# EasyEDA Pro project SOP100E 2025.05.27.eprj, board PCB2
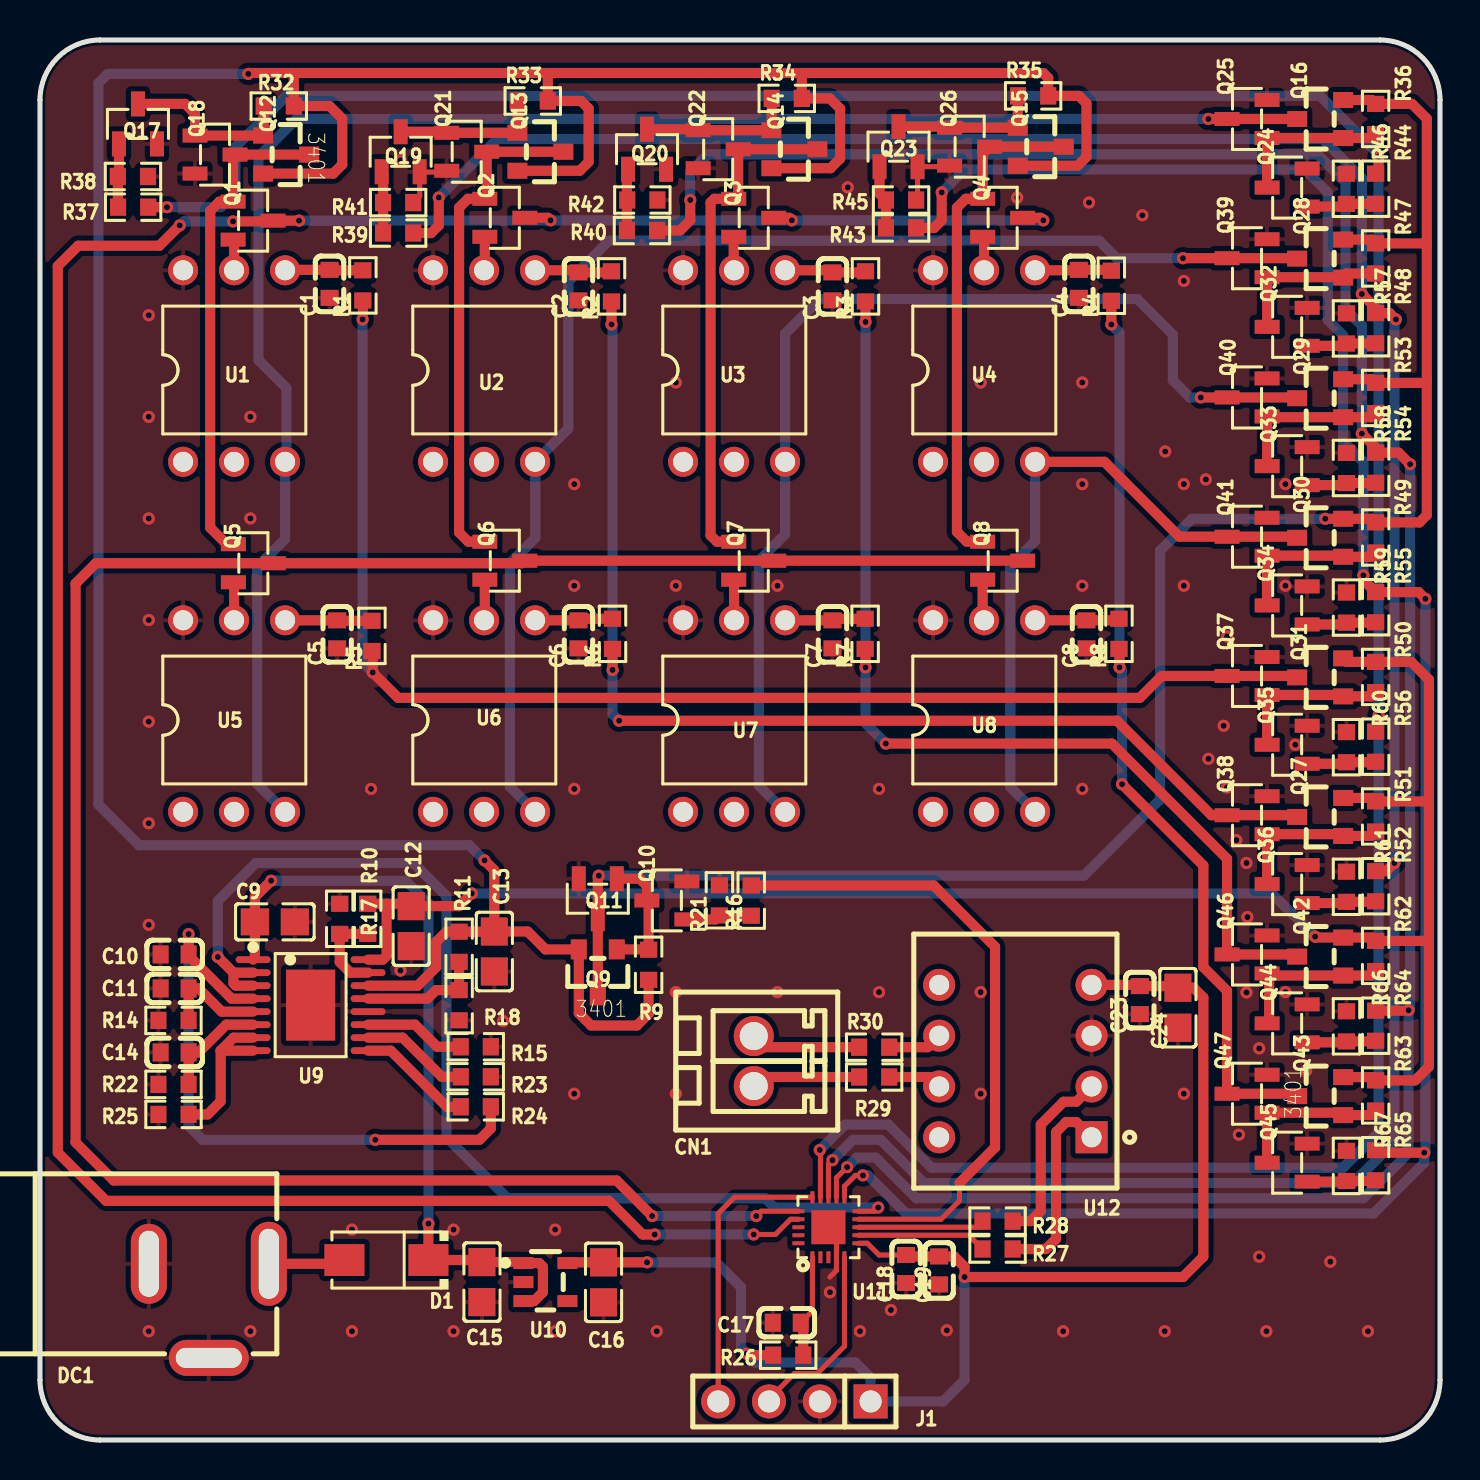
[diagram p17: board, top side]
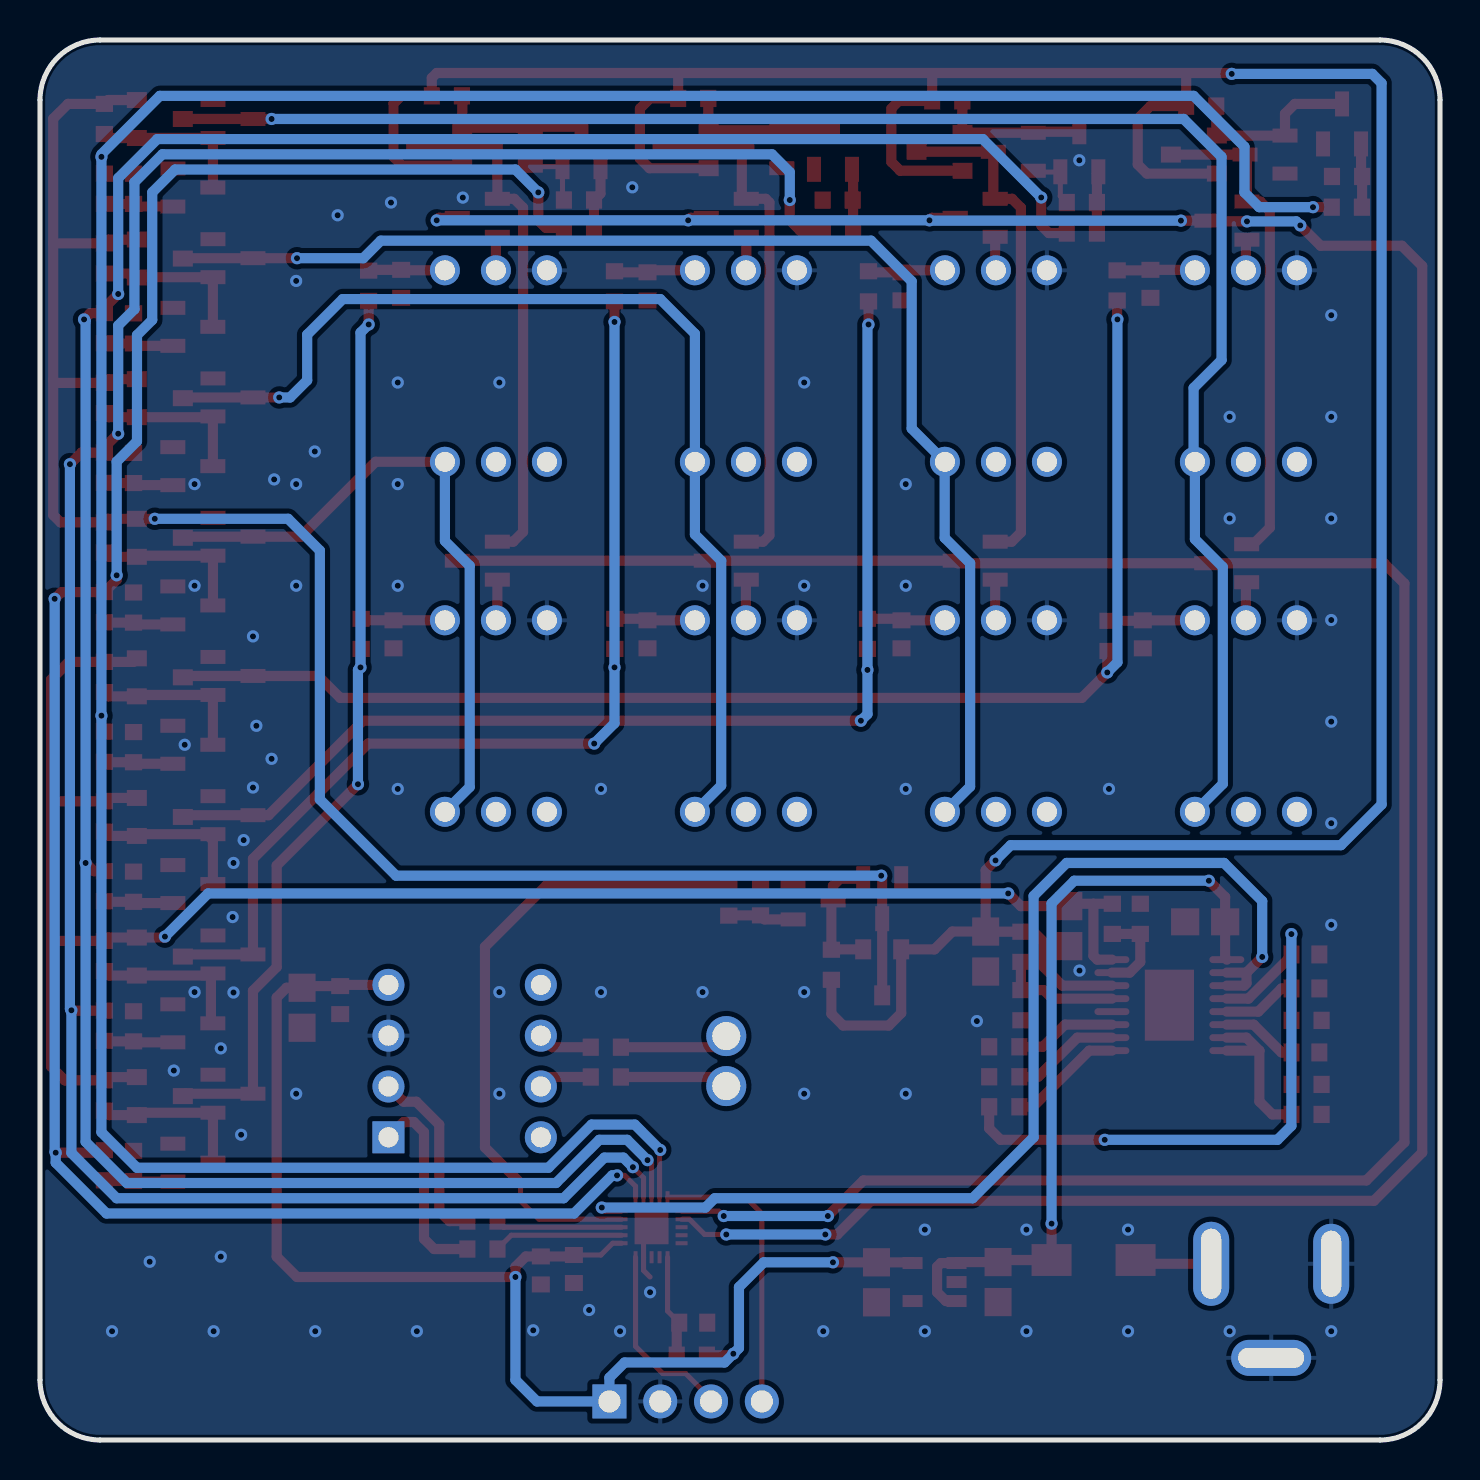
[diagram p18: board, bottom side, seen from below]

Outline 70 x 70 mm; copper layers: Top Layer, Bottom Layer. Coordinates in mm from the lower left corner of the outline.
Outline path: 0,67 0,3 arc(0.88,0.88) 3,0 67,0 arc(69.12,0.88) 70,3 70,67 arc(69.12,69.12) 67,70 3,70 arc(0.88,69.12) 0,67
Stack: Top Layer 0.035mm / Dielectric1 1.51mm FR4 er 4.5 / Bottom Layer 0.035mm

## Design rules (mm)
template: JLCPCB Capability(Two Layers Board)
spacing copperThickness1oz (default): track to track 0.102, other pairs 0.152 to 0.3
spacing copperThickness2oz: track to track 0.203, other pairs 0.152 to 0.3
track width copperThickness1oz (default): min 0.127, default 0.254, max 2.54
track width copperThickness2oz: min 0.203, default 0.254, max 2.54
differential pair differentialPair (default): width min 0.127, default 0.254, max 2.54; gap min 0.152, default 0.152
via viaSize (default): diameter min 0.5, default 0.61, max 10; hole min 0.3, default 0.305, max 6.3

## Placement (name value [footprint] x y rotation side)
C1  100nF  [C0603]  14.48 57.81 90 top
C2  100nF  [C0603]  26.92 57.68 90 top
C3  100nF  [C0603]  39.62 57.68 90 top
C4  100nF  [C0603]  51.94 57.81 90 top
C5  100nF  [C0603]  14.86 40.28 90 top
C6  100nF  [C0603]  26.92 40.28 90 top
C7  100nF  [C0603]  39.62 40.28 90 top
C8  100nF  [C0603]  52.32 40.28 90 top
C9  22uF  [C0805]  11.74 25.91 0 top
C10  1uF  [C0603]  6.73 24.28 0 top
C11  1uF  [C0603]  6.73 22.58 0 top
C12  22uF  [C0805]  18.56 25.69 90 top
C13  22uF  [C0805]  22.72 24.42 90 top
C14  1uF  [C0603]  6.73 19.38 0 top
C15  22uF  [C0805]  22.1 7.9 90 top
C16  22uF  [C0805]  28.18 7.88 90 top
C17  100nF  [C0603]  37.34 5.87 0 top
C18  100nF  [C0603]  43.31 8.55 90 top
C19  100nF  [C0603]  44.96 8.48 90 top
C23  100nF  [C0603]  54.99 21.99 270 top
C24  22uF  [C0805]  56.9 21.61 270 top
CN1  DB2EVC-2.5-2P-GN  [CONN-TH_2P-P2.50_DB2EVC-2.5-2P-GN]  35.69 18.95 90 top
D1  SS34  [SMA_L4.3-W2.5-LS5.0-RD]  17.32 9 180 top
DC1  DC-005-5A-2.0  [DC-IN-TH_DC-005-5A-2.0]  8.44 6.46 0 top
J1  PZ254V-11-04P  [HDR-TH_4P-P2.54-V-M]  37.72 1.93 180 top
Q1  AO3400A  [SOT-23-3_L2.9-W1.3-P1.90-LS2.4-BR]  10.66 60.97 180 top
Q2  AO3400A  [SOT-23-3_L2.9-W1.3-P1.90-LS2.4-BR]  23.24 61.11 180 top
Q3  AO3400A  [SOT-23-3_L2.9-W1.3-P1.90-LS2.4-BR]  35.69 61.11 180 top
Q4  AO3400A  [SOT-23-3_L2.9-W1.3-P1.90-LS2.4-BR]  48.13 61.11 180 top
Q5  AO3400A  [SOT-23-3_L2.9-W1.3-P1.90-LS2.4-BR]  10.67 43.84 180 top
Q6  AO3400A  [SOT-23-3_L2.9-W1.3-P1.90-LS2.4-BR]  23.24 43.97 180 top
Q7  AO3400A  [SOT-23-3_L2.9-W1.3-P1.90-LS2.4-BR]  35.69 43.97 180 top
Q8  AO3400A  [SOT-23-3_L2.9-W1.3-P1.90-LS2.4-BR]  48.13 43.97 180 top
Q9  AO3401A  [SOT-23_L2.9-W1.3-P1.90-LS2.4-BR]  27.89 23.38 90 top
Q10  AO3400A  [SOT-23-3_L2.9-W1.3-P1.90-LS2.4-BR]  31.34 26.98 0 top
Q11  AO3400A  [SOT-23-3_L2.9-W1.3-P1.90-LS2.4-BR]  27.89 27.06 90 top
Q12  AO3401A  [SOT-23_L2.9-W1.3-P1.90-LS2.4-BR]  12.31 64.27 180 top
Q13  AO3401A  [SOT-23_L2.9-W1.3-P1.90-LS2.4-BR]  25.02 64.41 180 top
Q14  AO3401A  [SOT-23_L2.9-W1.3-P1.90-LS2.4-BR]  37.72 64.54 180 top
Q15  AO3401A  [SOT-23_L2.9-W1.3-P1.90-LS2.4-BR]  50.04 64.67 180 top
Q16  AO3401A  [SOT-23_L2.9-W1.3-P1.90-LS2.4-BR]  64.01 66.05 0 top
Q17  AO3400A  [SOT-23-3_L2.9-W1.3-P1.90-LS2.4-BR]  4.9 65.8 270 top
Q18  AO3400A  [SOT-23-3_L2.9-W1.3-P1.90-LS2.4-BR]  8.75 64.27 180 top
Q19  AO3400A  [SOT-23-3_L2.9-W1.3-P1.90-LS2.4-BR]  18.03 64.41 270 top
Q20  AO3400A  [SOT-23-3_L2.9-W1.3-P1.90-LS2.4-BR]  30.35 64.54 270 top
Q21  AO3400A  [SOT-23-3_L2.9-W1.3-P1.90-LS2.4-BR]  21.34 64.41 180 top
Q22  AO3400A  [SOT-23-3_L2.9-W1.3-P1.90-LS2.4-BR]  33.91 64.54 180 top
Q23  AO3400A  [SOT-23-3_L2.9-W1.3-P1.90-LS2.4-BR]  42.93 64.67 270 top
Q24  AO3400A  [SOT-23-3_L2.9-W1.3-P1.90-LS2.4-BR]  62.36 62.62 0 top
Q25  AO3400A  [SOT-23-3_L2.9-W1.3-P1.90-LS2.4-BR]  60.35 66.05 0 top
Q26  AO3400A  [SOT-23-3_L2.9-W1.3-P1.90-LS2.4-BR]  46.48 64.67 180 top
Q27  AO3401A  [SOT-23_L2.9-W1.3-P1.90-LS2.4-BR]  64.01 31.15 0 top
Q28  AO3401A  [SOT-23_L2.9-W1.3-P1.90-LS2.4-BR]  64.01 59.07 0 top
Q29  AO3401A  [SOT-23_L2.9-W1.3-P1.90-LS2.4-BR]  64.01 52.09 0 top
Q30  AO3401A  [SOT-23_L2.9-W1.3-P1.90-LS2.4-BR]  64.01 45.11 0 top
Q31  AO3401A  [SOT-23_L2.9-W1.3-P1.90-LS2.4-BR]  64.01 38.13 0 top
Q32  AO3400A  [SOT-23-3_L2.9-W1.3-P1.90-LS2.4-BR]  62.36 55.66 0 top
Q33  AO3400A  [SOT-23-3_L2.9-W1.3-P1.90-LS2.4-BR]  62.36 48.69 0 top
Q34  AO3400A  [SOT-23-3_L2.9-W1.3-P1.90-LS2.4-BR]  62.36 41.73 0 top
Q35  AO3400A  [SOT-23-3_L2.9-W1.3-P1.90-LS2.4-BR]  62.36 34.76 0 top
Q36  AO3400A  [SOT-23-3_L2.9-W1.3-P1.90-LS2.4-BR]  62.36 27.8 0 top
Q37  AO3400A  [SOT-23-3_L2.9-W1.3-P1.90-LS2.4-BR]  60.35 38.2 0 top
Q38  AO3400A  [SOT-23-3_L2.9-W1.3-P1.90-LS2.4-BR]  60.35 31.24 0 top
Q39  AO3400A  [SOT-23-3_L2.9-W1.3-P1.90-LS2.4-BR]  60.35 59.09 0 top
Q40  AO3400A  [SOT-23-3_L2.9-W1.3-P1.90-LS2.4-BR]  60.35 52.13 0 top
Q41  AO3400A  [SOT-23-3_L2.9-W1.3-P1.90-LS2.4-BR]  60.35 45.16 0 top
Q42  AO3401A  [SOT-23_L2.9-W1.3-P1.90-LS2.4-BR]  64.01 24.17 0 top
Q43  AO3401A  [SOT-23_L2.9-W1.3-P1.90-LS2.4-BR]  64.01 17.19 0 top
Q44  AO3400A  [SOT-23-3_L2.9-W1.3-P1.90-LS2.4-BR]  62.36 20.83 0 top
Q45  AO3400A  [SOT-23-3_L2.9-W1.3-P1.90-LS2.4-BR]  62.36 13.87 0 top
Q46  AO3400A  [SOT-23-3_L2.9-W1.3-P1.90-LS2.4-BR]  60.35 24.28 0 top
Q47  AO3400A  [SOT-23-3_L2.9-W1.3-P1.90-LS2.4-BR]  60.35 17.31 0 top
R1  100R  [R0603]  16.14 57.73 90 top
R2  100R  [R0603]  28.57 57.68 90 top
R3  100R  [R0603]  41.28 57.68 90 top
R4  100R  [R0603]  53.57 57.71 90 top
R5  100R  [R0603]  16.6 40.21 90 top
R6  100R  [R0603]  28.63 40.31 90 top
R7  100R  [R0603]  41.26 40.31 90 top
R8  100R  [R0603]  53.95 40.31 90 top
R9  10K  [R0603]  30.43 23.76 270 top
R10  10K  [R0603]  16.38 26.06 90 top
R11  10K  [R0603]  20.96 24.66 90 top
R14  4.7K  [R0603]  6.68 20.98 0 top
R15  1K  [R0603]  21.79 19.66 0 top
R16  10R  [R0603]  35.56 26.97 270 top
R17  3.3K  [R0603]  14.99 26.06 270 top
R18  2K  [R0603]  20.96 21.74 90 top
R21  10K  [R0603]  33.97 26.98 270 top
R22  4.7K  [R0603]  6.68 17.78 0 top
R23  1K  [R0603]  21.79 18.16 0 top
R24  2K  [R0603]  21.79 16.66 180 top
R25  1K  [R0603]  6.68 16.28 180 top
R26  10K  [R0603]  37.41 4.24 180 top
R27  1k  [R0603]  47.88 9.55 180 top
R28  1k  [R0603]  47.88 10.94 180 top
R29  0  [R0603]  41.71 18.15 0 top
R30  0  [R0603]  41.71 19.64 0 top
R32  10K  [R0603]  11.94 66.7 0 top
R33  10K  [R0603]  24.64 66.95 0 top
R34  10K  [R0603]  37.34 67.08 0 top
R35  10K  [R0603]  49.66 67.21 0 top
R36  10K  [R0603]  66.78 66.05 90 top
R37  10R  [R0603]  4.66 61.64 180 top
R38  10K  [R0603]  4.65 63.18 180 top
R39  10R  [R0603]  17.91 60.35 180 top
R40  10R  [R0603]  30.1 60.47 180 top
R41  10K  [R0603]  17.91 61.87 180 top
R42  10K  [R0603]  30.12 62 180 top
R43  10R  [R0603]  43.05 60.6 180 top
R44  10R  [R0603]  66.78 62.56 270 top
R45  10K  [R0603]  43.05 62 180 top
R46  10K  [R0603]  65.32 62.56 270 top
R47  10K  [R0603]  66.78 59.08 90 top
R48  10K  [R0603]  66.78 52.1 90 top
R49  10K  [R0603]  66.78 45.13 90 top
R50  10K  [R0603]  66.78 38.15 90 top
R51  10K  [R0603]  66.78 31.18 90 top
R52  10R  [R0603]  66.78 27.69 270 top
R53  10R  [R0603]  66.78 55.59 270 top
R54  10R  [R0603]  66.78 48.61 270 top
R55  10R  [R0603]  66.78 41.64 270 top
R56  10R  [R0603]  66.78 34.66 270 top
R57  10K  [R0603]  65.32 55.58 270 top
R58  10K  [R0603]  65.32 48.6 270 top
R59  10K  [R0603]  65.32 41.62 270 top
R60  10K  [R0603]  65.32 34.64 270 top
R61  10K  [R0603]  65.32 27.66 270 top
R62  10K  [R0603]  66.78 24.2 90 top
R63  10K  [R0603]  66.78 17.23 90 top
R64  10R  [R0603]  66.78 20.71 270 top
R65  10R  [R0603]  66.78 13.74 270 top
R66  10K  [R0603]  65.32 20.68 270 top
R67  10K  [R0603]  65.32 13.7 270 top
U1  WF100E 1BG S6 DA 0.5P4.5 AT  [SOP-6_L7.0-W7.0-P2.54-LS10.3-TL-CW]  9.71 53.5 0 top
U2  WF100E 1BG S6 DA 0.5P4.5 AT  [SOP-6_L7.0-W7.0-P2.54-LS10.3-TL-CW]  22.21 53.5 0 top
U3  WF100E 1BG S6 DA 0.5P4.5 AT  [SOP-6_L7.0-W7.0-P2.54-LS10.3-TL-CW]  34.71 53.5 0 top
U4  WF100E 1BG S6 DA 0.5P4.5 AT  [SOP-6_L7.0-W7.0-P2.54-LS10.3-TL-CW]  47.21 53.5 0 top
U5  WF100E 1BG S6 DA 0.5P4.5 AT  [SOP-6_L7.0-W7.0-P2.54-LS10.3-TL-CW]  9.71 36 0 top
U6  WF100E 1BG S6 DA 0.5P4.5 AT  [SOP-6_L7.0-W7.0-P2.54-LS10.3-TL-CW]  22.21 36 0 top
U7  WF100E 1BG S6 DA 0.5P4.5 AT  [SOP-6_L7.0-W7.0-P2.54-LS10.3-TL-CW]  34.71 36 0 top
U8  WF100E 1BG S6 DA 0.5P4.5 AT  [SOP-6_L7.0-W7.0-P2.54-LS10.3-TL-CW]  47.21 36 0 top
U9  TPS7B7702QPWPRQ1  [HTSSOP-16_L5.0-W4.4-P0.65-LS6.4-BL-EP]  13.53 21.74 270 top
U10  TPSPX3819M5-L-5-0  [SOT-23-5_L2.9-W1.6-P0.95-LS2.8-BR]  25.27 7.9 180 top
U11  PY32F002BF15U6TR  [QFN-20_L3.0-W3.0-P0.40-TL-EP1.7]  39.42 10.64 90 top
U12  TD301M485  [COMM-TH_TD301M485]  48.77 18.95 90 top

## Footprints (pads in the part's own frame, mm; a bottom-side part is the same pattern mirrored in y, then rotated)
C0603
  rect 0.8x0.9 smd: 1(-0.7,0) 2(0.7,0)
C0805
  rect 1.41x1.35 smd: 1(-1,0) 2(1,0)
COMM-TH_TD301M485
  rect 1.6x1.6 hole 1: 1(-3.81,-3.81)
  round 1.6 hole 1: 2(-1.27,-3.81) 3(1.27,-3.81) 4(3.81,-3.81) 5(3.81,3.81) 6(1.27,3.81) 7(-1.27,3.81) 8(-3.81,3.81)
CONN-TH_2P-P2.50_DB2EVC-2.5-2P-GN
  round 2 hole 1.4: 1(-1.25,0) 2(1.25,0)
DC-IN-TH_DC-005-5A-2.0
  oval 1.8x4.2 hole 1x3.5: 1(3,2.352)
  oval 1.8x4 hole 1x3.3: 2(-3,2.352)
  oval 4x1.8 hole 3.3x1: 3(-0.001,-2.352)
HDR-TH_4P-P2.54-V-M
  rect 1.7x1.7 hole 1.1: 1(-3.81,0)
  round 1.7 hole 1.1: 2(-1.27,0) 3(1.27,0) 4(3.81,0)
HTSSOP-16_L5.0-W4.4-P0.65-LS6.4-BL-EP
  oval 0.343x1.746 smd: 1(-2.275,-2.873) 2(-1.625,-2.873) 3(-0.975,-2.873) 4(-0.325,-2.873) 5(0.325,-2.873) 6(0.975,-2.873) 7(1.625,-2.873) 8(2.275,-2.873) 9(2.275,2.873) 10(1.625,2.873) 11(0.975,2.873) 12(0.325,2.873) 13(-0.325,2.873) 14(-0.975,2.873) 15(-1.625,2.873) 16(-2.275,2.873)
  rect 3.55x2.46 smd: 17(0,0)
QFN-20_L3.0-W3.0-P0.40-TL-EP1.7
  rect 0.6x0.2 smd: 1(-1.5,0.8) 2(-1.5,0.401) 3(-1.5,0) 4(-1.5,-0.4) 5(-1.5,-0.8) 11(1.5,-0.8) 12(1.5,-0.4) 13(1.5,0) 14(1.5,0.401) 15(1.5,0.8)
  rect 0.2x0.6 smd: 6(-0.8,-1.5) 7(-0.4,-1.5) 8(0,-1.5) 9(0.4,-1.5) 10(0.799,-1.5) 16(0.8,1.5) 17(0.4,1.5) 18(0,1.5) 19(-0.4,1.5) 20(-0.8,1.5)
  rect 1.7x1.7 smd: 21(0,0)
R0603
  rect 0.806x0.864 smd: 1(-0.753,0) 2(0.753,0)
SMA_L4.3-W2.5-LS5.0-RD
  rect 2x1.593 smd: 1(-2.1,0) 2(2.1,0)
SOP-6_L7.0-W7.0-P2.54-LS10.3-TL-CW
  round 1.5 hole 1: 1(-2.56,4.986) 2(-0.01,4.986) 3(2.54,4.986) 4(2.54,-4.59) 5(-0.01,-4.59) 6(-2.56,-4.59)
SOT-23-3_L2.9-W1.3-P1.90-LS2.4-BR
  rect 1.25x0.7 smd: 1(1,-0.95) 2(1,0.95) 3(-1,0)
SOT-23-5_L2.9-W1.6-P0.95-LS2.8-BR
  rect 1x0.6 smd: 1(1.1,-0.95) 2(1.1,0) 3(1.1,0.95) 4(-1.1,0.95) 5(-1.1,-0.95)
SOT-23_L2.9-W1.3-P1.90-LS2.4-BR
  rect 1x0.8 smd: 1(1.15,-0.95) 2(1.15,0.95) 3(-1.15,0)

## Nets
As in the schematic.

Pads without a net: U1 5 6; U2 5 6; U3 5 6; U4 5 6; U5 5 6; U6 5 6; U7 5 6; U8 5 6; U10 4; U11 2 3 18 19 20; U12 5 8

## Via types
v1: diameter 0.61, hole 0.305, Top Layer to Bottom Layer, 134 vias

## Routing (per net, layer and track width the routed paths; a pad name or vN(x,y) marks a point on that pad's centre or on a via; arc(x,y) is an arc through that point)
+7.5V: length 169.3
  Top Layer w0.508: Q12.2 14.66,63.32 15.11,63.78 15.11,66.06 14.48,66.7 R32.2 12.69,68.35 ; 38.03,68.35 38.09,68.28 R34.2 39.49,67.08 40,66.57 40,64.07 39.52,63.59 Q14.2 ; 38.03,68.35 50.16,68.35 50.41,68.1 R35.2 51.94,67.21 52.32,66.83 52.32,64.16 51.88,63.72 Q15.2 ; 38.03,68.35 25.35,68.35 ; 25.35,68.35 12.69,68.35 ; 25.35,68.35 25.39,68.31 R33.2 27.05,66.95 27.43,66.57 27.43,63.9 26.99,63.46 Q13.2 ; 12.69,68.35 10.46,68.35 v1(10.41,68.31) ; C13.2 22.71,25.41 R11.2 20.32,25.41 19.81,24.91 19.81,23.64 18.89,22.72 U9.14 ; C13.2 24.38,25.42 25.28,24.53 Q9.2 26.94,21.34 27.56,20.72 29.84,20.72 30.43,21.31 R9.2 ; C13.2 22.72,28.49 v1(22.22,28.98)
  Bottom Layer w0.508: v1(22.22,28.98) 21.46,29.74 4.95,29.74 2.92,31.77 2.92,67.84 3.39,68.31 v1(10.41,68.31)
GND: length 9.1
  Top Layer w0.254: 39.5,8.15 39.82,8.48 39.82,10.24 39.42,10.64 ; R41.1 18.98,62.2 18.98,63.4 20.27,63.4 Q21.2 ; R45.1 43.88,62.07 Q23.2 45.43,63.67 Q26.2
  vias: v1(5.44,56.24) v1(5.44,51.16) v1(5.44,46.08) v1(5.44,41) v1(5.44,35.92) v1(5.44,30.84) v1(5.44,25.76) v1(5.44,5.44) v1(10.52,51.16) v1(10.52,46.08) v1(10.52,5.44) v1(15.6,10.52) v1(15.6,5.44) v1(16.55,32.55) v1(18.03,63.99) v1(18.03,23.47) v1(20.68,10.52) v1(20.68,5.44) v1(23.16,20.94) v1(25.76,10.52) v1(25.76,5.44) v1(26.71,47.79) v1(26.71,42.71) v1(26.71,32.55) v1(26.71,17.31) v1(30.84,5.44) v1(31.79,52.87) v1(31.79,42.71) v1(31.79,22.39) v1(31.79,17.31) v1(36.87,42.71) v1(36.87,22.39) v1(39.5,7.39) v1(40.39,62.63) v1(41,5.44) v1(41.95,32.55) v1(41.95,22.39) v1(42.54,6.5) v1(45.34,5.48) v1(47.03,52.87) v1(47.03,22.39) v1(47.03,17.31) v1(48.86,62.12) v1(51.16,5.44) v1(52.11,52.87) v1(52.11,47.79) v1(52.11,42.71) v1(52.11,32.55) v1(52.45,61.87) v1(55.12,61.24) v1(56.24,5.44) v1(56.26,49.43) v1(57.19,57.95) v1(57.19,47.79) v1(57.19,42.71) v1(57.19,17.31) v1(58.29,48.03) v1(58.42,34.06) v1(59.18,35.71) v1(59.35,40.18) v1(59.35,32.62) v1(59.82,30) v1(59.94,15.26) v1(60.32,28.85) v1(60.32,22.38) v1(60.37,26.15) v1(60.96,19.58) v1(60.96,9.17) v1(61.32,5.44) v1(62.27,47.79) v1(62.27,42.71) v1(62.27,22.39) v1(62.76,34.76) v1(63.31,18.47) v1(64.52,8.91) v1(66.4,5.44)
V75_FB: length 6.1
  Top Layer w0.508: R11.1 R18.2 19.8,22.49 19.38,22.07 U9.13
VCC: length 69.6
  Top Layer w0.254: U11.6 41.37,9.84 41.96,9.25 C18.2
  Top Layer w0.508: C18.2 43.38,9.18 C19.2 45.71,9.18 46.23,8.66 v1(46.23,8.15) 57.15,8.15 58.17,9.17 58.17,22.12 57.67,22.61 C24.1 56.81,22.69 C23.1 54.93,22.76 U12.4 ; R26.2 35.41,4.24 v1(35.33,4.31) ; v1(30.35,8.88) C16.2 26.41,8.88 26.37,8.85
  Bottom Layer w0.508: v1(46.23,8.15) 46.23,3 45.15,1.93 J1.1 41.53,3.11 40.77,3.88 35.77,3.88 v1(35.33,4.31) 35.05,4.59 35.05,7.64 33.81,8.88 v1(30.35,8.88)
VCC_1: length 31.5
  Top Layer w0.508: R24.1 22.54,15.58 21.97,15.01 v1(16.76,15.01) ; v1(7.43,25.3) C10.2 7.43,24.22 9.58,22.07 U9.4
  Bottom Layer w0.508: v1(7.43,25.3) 7.43,15.71 8.13,15.01 v1(16.76,15.01)
VDD: length 90.7
  Top Layer w0.508: 69.45,31.83 69.45,38.02 68.56,38.91 65.33,38.91 Q31.2 ; 69.45,31.83 69.45,25.02 ; 69.45,31.83 69.35,31.93 R51.2 66.61,32.1 Q27.2 ; 18.18,26.69 18.06,26.81 17.33,26.81 ; 69.45,25.02 69.45,18.67 68.76,17.98 R63.2 66.62,18.14 Q43.2 ; 69.45,25.02 69.38,24.95 R62.2 66.61,25.12 Q42.2 63.8,25.12 v1(63.75,25.17) ; v1(21.59,27.33) 20.96,26.69 C12.2 ; U9.16 17.14,24.02 17.33,24.21 17.33,26.81 ; 17.33,26.81 R10.2
  Bottom Layer w0.508: v1(21.59,27.33) 61.59,27.33 v1(63.75,25.17)
VDD1: length 67.1
  Top Layer w0.508: v1(16.13,56.03) 16.14,56.04 R1.1 ; R5.1 16.64,39.41 v1(16.64,38.38) 17.91,37.11 54.99,37.11 56.09,38.2 Q37.3 62.79,38.2 Q31.3
  Bottom Layer w0.508: v1(16.64,38.38) 16.13,38.89 v1(16.13,56.03)
VDD1_EN: length 149.5
  Top Layer w0.254: U11.14 39.02,14.47 v1(38.99,14.5)
  Top Layer w0.508: R37.1 v1(6.35,61.64) ; R44.1 66.93,63.47 v1(66.93,64.16) ; R56.1 66.93,35.56 v1(66.93,36.22)
  Bottom Layer w0.508: v1(38.99,14.5) 40.26,15.77 42.42,15.77 44.58,13.61 65.15,13.61 66.93,15.39 v1(66.93,36.22) v1(66.93,64.16) 66.93,64.28 64.01,67.21 12.32,67.21 9.78,64.67 9.78,62.38 9.04,61.64 v1(6.35,61.64)
VDD2: length 58.1
  Top Layer w0.508: R2.1 v1(28.57,55.78) ; R6.1 v1(28.63,38.5) ; Q27.3 62.77,31.24 Q38.3 58.57,31.24 53.85,35.96 v1(28.96,35.96)
  Bottom Layer w0.508: v1(28.96,35.96) 28.63,36.29 v1(28.63,38.5) 28.63,55.72 v1(28.57,55.78)
VDD2_EN: length 133.6
  Top Layer w0.254: 39.42,12.14 39.42,13.79 v1(39.62,13.99)
  Top Layer w0.508: v1(67.8,56.03) 67.49,56.34 R53.1 66.78,56.61 v1(66.09,57.3) ; v1(67.72,28.85) 67.31,28.44 R52.1 ; v1(19.94,62.13) 19.94,60.73 19.56,60.35 R39.1
  Bottom Layer w0.508: v1(19.94,62.13) 22.86,65.05 64.13,65.05 66.09,63.09 v1(66.09,57.3) ; v1(67.8,56.03) 67.72,55.95 v1(67.72,28.85) 67.72,14.91 65.66,12.85 44.2,12.85 42.04,15.01 40.64,15.01 v1(39.62,13.99)
VDD3: length 51.2
  Top Layer w0.508: R7.1 41.28,39.54 v1(41.28,38.63) ; Q42.3 62.75,24.28 Q46.3 59.35,29.06 53.59,34.82 v1(42.29,34.82) ; R3.1 v1(41.28,55.9)
  Bottom Layer w0.508: v1(41.28,55.9) v1(41.28,38.63) 41.28,35.84 v1(42.29,34.82)
VDD3_EN: length 122
  Top Layer w0.254: 39.82,12.14 39.82,13.11 v1(40.35,13.64)
  Top Layer w0.508: v1(68.43,21.49) 68.41,21.47 R64.1 ; v1(32.51,62) 32.51,60.98 32,60.47 R40.1 ; v1(66.09,50.31) 66.78,49.62 R54.1 67.93,49.37 v1(68.5,48.79)
  Bottom Layer w0.508: v1(68.5,48.79) 68.5,21.56 v1(68.43,21.49) 68.43,14.35 66.17,12.09 43.81,12.09 41.78,14.12 40.83,14.12 v1(40.35,13.64) ; v1(66.09,50.31) 66.09,55.72 65.28,56.54 65.28,62.89 63.88,64.28 33.4,64.28 32.51,63.4 v1(32.51,62)
VDD4: length 46.5
  Top Layer w0.508: v1(54.1,32.79) 58.17,28.72 58.17,23.64 59.35,22.46 Q47.3 62.74,17.31 Q43.3 ; v1(53.97,38.63) 53.97,39.53 R8.1 ; R4.1 v1(53.57,55.78)
  Bottom Layer w0.508: v1(54.1,32.79) 54.1,38.5 v1(53.97,38.63) 53.97,55.37 v1(53.57,55.78)
VDD4_EN: length 109
  Top Layer w0.254: U11.11 40.22,12.69 40.77,13.23 v1(41.15,13.23)
  Top Layer w0.508: v1(66.17,43.23) 66.17,43.01 R55.1 68.94,42.39 v1(69.27,42.06) ; v1(69.22,14.37) 66.91,14.37 R65.1 ; v1(45.09,62.38) 45.09,60.98 44.7,60.6 R43.1
  Bottom Layer w0.508: v1(69.27,42.06) 69.27,14.42 v1(69.22,14.37) 69.22,13.87 66.68,11.33 43.3,11.33 41.39,13.23 v1(41.15,13.23) ; v1(45.09,62.38) 46.23,63.52 63.25,63.52 64.39,62.38 64.39,56 65.15,55.24 65.15,49.93 66.17,48.92 v1(66.17,43.23)
VDD_EN: length 55.5
  Top Layer w0.254: U11.10 41.73,11.44 v1(41.91,11.62)
  Top Layer w0.508: 9.67,23.37 U9.2 ; 9.67,23.37 9.67,22.83 9.79,22.72 U9.3 ; 9.67,23.37 v1(8.89,24.15)
  Bottom Layer w0.508: v1(8.89,24.15) 8.89,26.95 10.8,28.85 18.67,28.85 20.32,27.2 20.32,15.14 23.37,12.09 36.26,12.09 36.73,11.62 v1(41.91,11.62)
VDD_FB: length 4.4
  Top Layer w0.508: R10.1 R17.2 14.99,23.9 15.52,23.37 U9.15
DC12V: length 38.8
  Top Layer w0.508: U10.3 24.7,6.95 25.15,7.39 25.15,8.66 24.96,8.85 24.17,8.85 24.12,8.9 C15.2 22,9 D1.1 v1(19.42,10.82) ; v1(11.56,27.96) 10.74,27.15 C9.1 10.74,24.1 U9.1
  Bottom Layer w0.508: v1(19.42,10.82) 19.42,26.83 18.29,27.96 v1(11.56,27.96)
OUT1: length 137
  Top Layer w0.254: U11.17 37.53,11.04 36.77,10.28 v1(35.69,10.28)
  Top Layer w0.508: v1(30.73,10.28) 30.13,10.28 28.45,11.96 3.3,11.96 0.89,14.37 0.89,58.7 1.91,59.71 5.97,59.71 v1(6.98,60.73) ; v1(50.16,60.98) 50.04,61.11 Q4.3 ; v1(25.53,60.98) 25.4,61.11 Q2.3 ; v1(9.65,60.93) 11.62,60.93 Q1.3 v1(12.95,60.97) ; v1(37.59,60.98) 37.47,61.11 Q3.3
  Bottom Layer w0.508: v1(50.16,60.98) v1(37.59,60.98) v1(25.53,60.98) 25.51,60.97 v1(12.95,60.97) ; v1(35.69,10.28) v1(30.73,10.28) ; v1(9.65,60.93) 7.19,60.93 v1(6.98,60.73)
OUT1_EN: length 24.8
  Top Layer w0.508: Q5.1 9.34,44.79 8.51,45.62 8.51,61.45 8.97,61.92 Q1.1 9.66,64.17 Q18.3 Q12.3
OUT2: length 113.5
  Top Layer w0.254: U11.16 36.05,11.44 v1(35.81,11.2)
  Top Layer w0.508: v1(30.61,11.2) 28.83,12.98 3.68,12.98 1.78,14.88 1.78,42.82 2.79,43.84 Q5.3 24.11,43.84 Q6.3 Q7.3 Q8.3
  Bottom Layer w0.508: v1(30.61,11.2) v1(35.81,11.2)
OUT2_EN: length 25.4
  Top Layer w0.508: Q6.1 21.42,44.92 20.96,45.38 20.96,61.62 21.4,62.06 Q2.1 22.34,62.16 Q21.3 Q13.3
OUT3_EN: length 25.7
  Top Layer w0.508: Q7.1 33.85,44.92 33.53,45.23 33.53,61.87 33.72,62.06 Q3.1 34.91,62.28 Q22.3 Q14.3
OUT4_EN: length 25.6
  Top Layer w0.508: Q8.1 46.34,44.92 45.85,45.41 45.85,61.62 46.29,62.06 Q4.1 47.13,64.32 Q26.3 Q15.3
RX_MCU: length 6.5
  Top Layer w0.254: R27.2 46.44,10.24 U11.7
SWCLK: length 14.4
  Top Layer w0.254: J1.4 33.91,11.33 34.72,12.14 U11.15
SWDIO: length 9.4
  Top Layer w0.254: J1.3 36.45,2.06 37.72,3.32 38.86,3.32 40.22,4.69 U11.5
TX_MCU: length 6.3
  Top Layer w0.254: R28.2 46.82,10.64 U11.8
VPP: length 95.3
  Top Layer w0.508: Q16.2 66.59,67 R36.2 68.6,66.81 69.34,66.06 69.34,52.99 ; 69.34,52.99 69.21,52.86 R48.2 66.6,53.04 Q29.2 ; 69.34,52.99 69.34,46.25 68.97,45.88 R49.2 66.6,46.06 Q30.2 v1(64.26,46.06) ; Q28.2 66.59,60.02 R47.2 69.34,59.83 ; Q9.3 Q11.3 27.89,28.17 v1(27.94,28.22)
  Bottom Layer w0.508: v1(27.94,28.22) 52.2,28.22 56.01,32.03 56.01,44.47 57.59,46.06 v1(64.26,46.06)
VPP1: length 87.5
  Top Layer w0.508: Q16.3 62.85,66.05 Q25.3 v1(58.42,66.05)
  Bottom Layer w0.508: U1.4 12.25,48.64 ; 12.25,48.64 12.32,48.7 12.32,52.6 10.92,54 10.92,64.16 12.82,66.05 v1(58.42,66.05) ; 12.25,48.64 12.25,45.04 10.86,43.65 10.86,32.8 U5.4
VPP2: length 65.9
  Top Layer w0.508: Q28.3 62.84,59.09 Q39.3 v1(57.15,59.09)
  Bottom Layer w0.508: v1(57.15,59.09) 53.84,59.09 52.96,59.97 28.45,59.97 26.42,57.94 26.42,50.57 U2.4 24.76,48.9 24.76,45.11 23.5,43.84 23.5,32.67 U6.4
VPP3: length 54.7
  Top Layer w0.508: Q29.3 62.82,52.13 Q40.3 v1(58.04,52.13)
  Bottom Layer w0.508: U7.4 35.94,32.72 35.94,43.97 37.25,45.28 U3.4 37.25,55.31 38.99,57.05 54.86,57.05 56.64,55.27 56.64,52.98 57.5,52.13 v1(58.04,52.13)
VPP4: length 33.2
  Top Layer w0.508: U4.4 53.22,48.91 56.97,45.16 Q41.3 62.8,45.16 Q30.3
  Bottom Layer w0.508: U8.4 48.51,32.65 48.51,43.71 49.75,44.95 U4.4
VPP_EN: length 32.3
  Top Layer w0.254: U11.9 45.05,11.04 45.97,11.96 45.97,12.85
  Top Layer w0.508: R16.1 44.69,27.72 47.75,24.66 47.75,14.63 45.97,12.85
$1N2752: length 3.9
  Top Layer w0.508: R1.2 14.5,58.48 C1.2 12.28,58.51 U1.3
$1N2758: length 1.6
  Top Layer w0.508: U1.2 9.7,59.97 Q1.2
$1N2764: length 3.9
  Top Layer w0.508: R2.2 28.52,58.38 C2.2 26.82,58.49 U2.3
$1N2770: length 1.7
  Top Layer w0.508: Q2.2 22.24,58.52 U2.2
$1N2776: length 4.1
  Top Layer w0.508: R3.2 41.22,58.38 C3.2 39.52,58.49 U3.3
$1N2782: length 1.7
  Top Layer w0.508: Q3.2 34.69,58.5 U3.2
$1N2788: length 3.8
  Top Layer w0.508: U4.3 51.92,58.49 C4.2 53.53,58.51 R4.2
$1N2794: length 1.7
  Top Layer w0.508: U4.2 47.2,60.09 Q4.2
$1N2812: length 4.4
  Top Layer w0.508: R5.2 14.88,40.96 C5.2 12.26,40.98 U5.3
$1N2818: length 1.9
  Top Layer w0.508: Q5.2 9.7,42.85 U5.2
$1N2824: length 3.9
  Top Layer w0.508: R6.2 27,41.06 C6.2 24.76,40.98 U6.3
$1N2830: length 2
  Top Layer w0.508: Q6.2 22.24,41.02 U6.2
$1N2836: length 4
  Top Layer w0.508: U7.3 37.26,40.98 C7.2 39.7,41.06 R7.2
$1N2842: length 2
  Top Layer w0.508: U7.2 34.7,43 Q7.2
$1N2848: length 4.2
  Top Layer w0.508: 52.32,40.99 C8.2 ; 52.32,40.99 53.87,40.99 R8.2 ; 52.32,40.99 U8.3
$1N2854: length 2.1
  Top Layer w0.508: Q8.2 47.13,41.06 U8.2
$1N4080: length 3.9
  Top Layer w0.508: DC1.1 15.03,8.81 D1.2
$1N4983: length 5.1
  Top Layer w0.508: R15.1 19.86,19.66 18.75,20.77 U9.11
$1N4984: length 5.4
  Top Layer w0.508: R23.1 20.09,18.16 18.13,20.12 U9.10
$1N4985: length 5.8
  Top Layer w0.508: R24.2 20.35,16.66 17.54,19.47 U9.9
$1N4990: length 5.3
  Top Layer w0.508: 7.43,22.58 C11.2 ; 7.43,22.58 7.93,22.58 9.08,21.42 U9.5 ; 7.43,22.58 R14.2
$1N4991: length 7.9
  Top Layer w0.508: U9.7 9.68,20.12 9.03,19.47 ; 9.03,19.47 U9.8 ; 9.03,19.47 9.03,16.93 8.38,16.28 R25.1
$1N4992: length 5.4
  Top Layer w0.508: U9.6 9.31,20.77 7.93,19.38 C14.2 7.43,17.78 R22.2
$1N5558: length 3.3
  Top Layer w0.508: Q10.1 33.77,26.03 R21.2 35.55,26.23 R16.2
$1N5563: length 6.5
  Top Layer w0.508: Q11.1 29.99,28.06 30.35,27.7 30.35,26.99 Q10.3 30.43,26.89 R9.1 30.41,24.53 Q9.1
$3N1296: length 2.7
  Top Layer w0.508: U12.7 44.49,18.15 R29.2
$3N1297: length 2.7
  Top Layer w0.508: R30.2 44.38,19.64 U12.6
$3N1304: length 5.5
  Top Layer w0.508: CN1.1 36.14,18.15 40.96,18.15
$3N1305: length 5.5
  Top Layer w0.508: CN1.2 36.24,19.64 40.96,19.64
$3N1306: length 10
  Top Layer w0.508: R27.1 50.29,9.55 50.8,10.06 50.8,15.39 51.31,15.9 51.82,15.9 U12.1
$3N1307: length 9.3
  Top Layer w0.508: R28.1 49.53,10.94 50.04,11.45 50.04,15.77 51.18,16.91 51.82,16.91 U12.2
$3N1779: length 5.2
  Top Layer w0.254: U11.1 38.62,6.45 C17.2
  Top Layer w0.508: 38.16,4.24 38.16,5.74 C17.2
$3N5093: length 9
  Top Layer w0.508: Q17.3 7.26,66.8 7.75,66.31 Q18.1 Q12.1 11.18,65.25 R32.1
$3N5095: length 3.2
  Top Layer w0.508: R37.2 3.89,61.65 R38.2 3.95,63.23 Q17.1
$3N5101: length 7.5
  Top Layer w0.508: R33.1 23.88,65.61 23.64,65.36 ; 23.64,65.36 Q21.1 20.29,65.41 Q19.3 ; 23.64,65.36 Q13.1
$3N5103: length 3.1
  Top Layer w0.508: Q19.1 17.15,63.34 R41.2 R39.2
$3N5107: length 3.1
  Top Layer w0.508: R40.2 29.35,63.48 Q20.1
$3N5110: length 8.2
  Top Layer w0.508: Q23.3 46.07,65.67 46.12,65.62 ; 46.12,65.62 Q26.1 ; 46.12,65.62 Q15.1 48.89,67.19 R35.1
$3N5113: length 7.8
  Top Layer w0.508: R34.1 36.58,65.5 Q14.1 Q22.1 32.86,65.54 Q20.3
$3N5119: length 3.2
  Top Layer w0.508: Q23.1 41.98,62.32 R45.2 R43.2
$3N5130: length 8
  Top Layer w0.508: 65.14,58.14 Q28.1 ; 65.14,58.14 Q39.1 61.36,58.13 Q32.3 ; 65.14,58.14 65.32,58.32 R47.1
$3N5133: length 3.5
  Top Layer w0.508: Q32.1 65.21,54.71 R57.2 66.77,54.83 R53.2
$3N5138: length 8
  Top Layer w0.508: Q33.3 61.36,51.17 ; 61.36,51.17 Q40.1 ; 61.36,51.17 61.39,51.14 Q29.1 66.57,51.14 R48.1
$3N5141: length 3.5
  Top Layer w0.508: Q33.1 65.22,47.74 R58.2 66.77,47.85 R54.2
$3N5146: length 8
  Top Layer w0.508: R49.1 66.57,44.16 Q30.1 65.1,44.21 Q41.1 61.35,41.73 Q34.3
$3N5149: length 3.5
  Top Layer w0.508: 63.36,40.78 65.23,40.78 R59.2 66.76,40.87 R55.2
$3N5154: length 8
  Top Layer w0.508: R50.1 66.56,37.18 Q31.1 65.09,37.25 Q37.1 61.36,37.25 Q35.3
$3N5157: length 3.5
  Top Layer w0.508: R56.2 66.76,33.89 R60.2 65.25,33.81 Q35.1
$3N5170: length 8
  Top Layer w0.508: Q44.3 61.46,20.93 61.46,23.22 ; 61.46,23.22 Q42.1 66.56,23.22 R62.1 ; 61.46,23.22 Q46.1
$3N5173: length 3.5
  Top Layer w0.508: R64.2 66.75,19.93 R66.2 65.28,19.88 Q44.1
$3N5178: length 8.1
  Top Layer w0.508: Q45.3 61.35,13.87 Q47.1 65.04,16.36 Q43.1 66.55,16.24 R63.1
$3N5181: length 3.5
  Top Layer w0.508: R65.2 66.75,12.95 65.32,12.95 65.29,12.92 Q45.1
$3N7897: length 8
  Top Layer w0.508: 66.78,65.3 66.58,65.1 Q16.1 65.15,65.1 Q25.1 61.35,62.63 Q24.3
$3N7898: length 3.5
  Top Layer w0.508: Q24.1 65.19,61.67 R46.2 66.78,61.81 R44.2
$3N8162: length 3.5
  Top Layer w0.508: R52.2 66.75,26.91 65.32,26.91 65.26,26.85 Q36.1
$3N8163: length 8.2
  Top Layer w0.508: Q38.1 61.65,30.29 ; 61.65,30.29 61.36,29.99 Q36.3 ; 61.65,30.29 65.07,30.29 Q27.1 66.56,30.2 R51.1

## Copper pours and planes (outline as drawn; the poured copper is in the pictures)
GND on Top Layer: 0,70 70,70 70,0 0,0
GND on Bottom Layer: 0,70 70,70 70,0 0,0

## Text on the board
Top Silkscreen Layer: 3401
